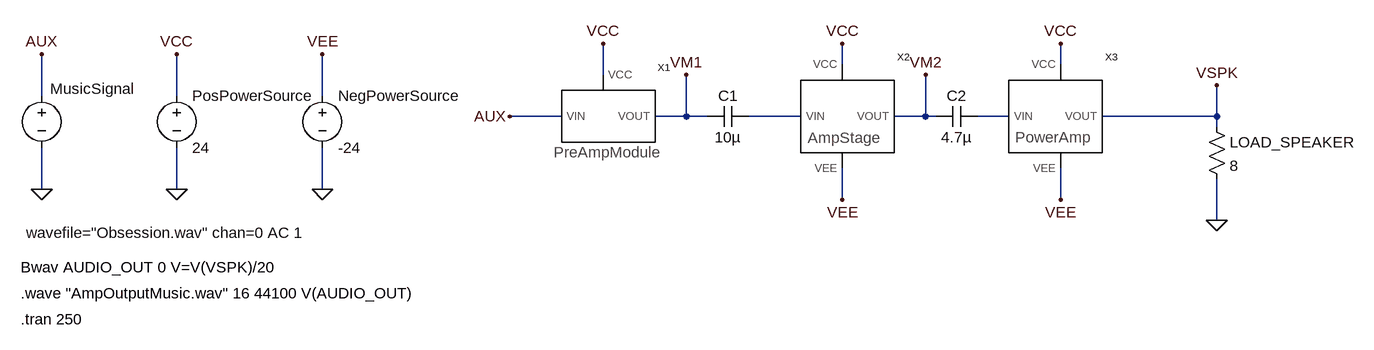
[diagram p0: schematic AnalogOne_AMP_Circuit_Integration.asc]
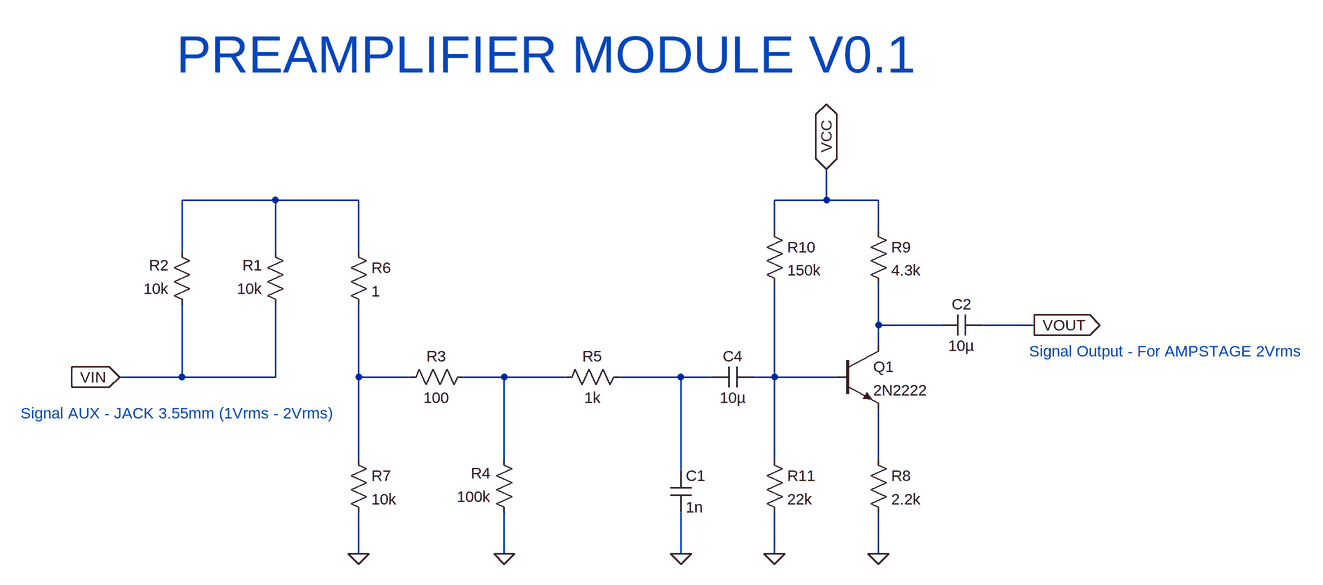
[diagram p1: sub-circuit preamplificacion_ltspice.asc]
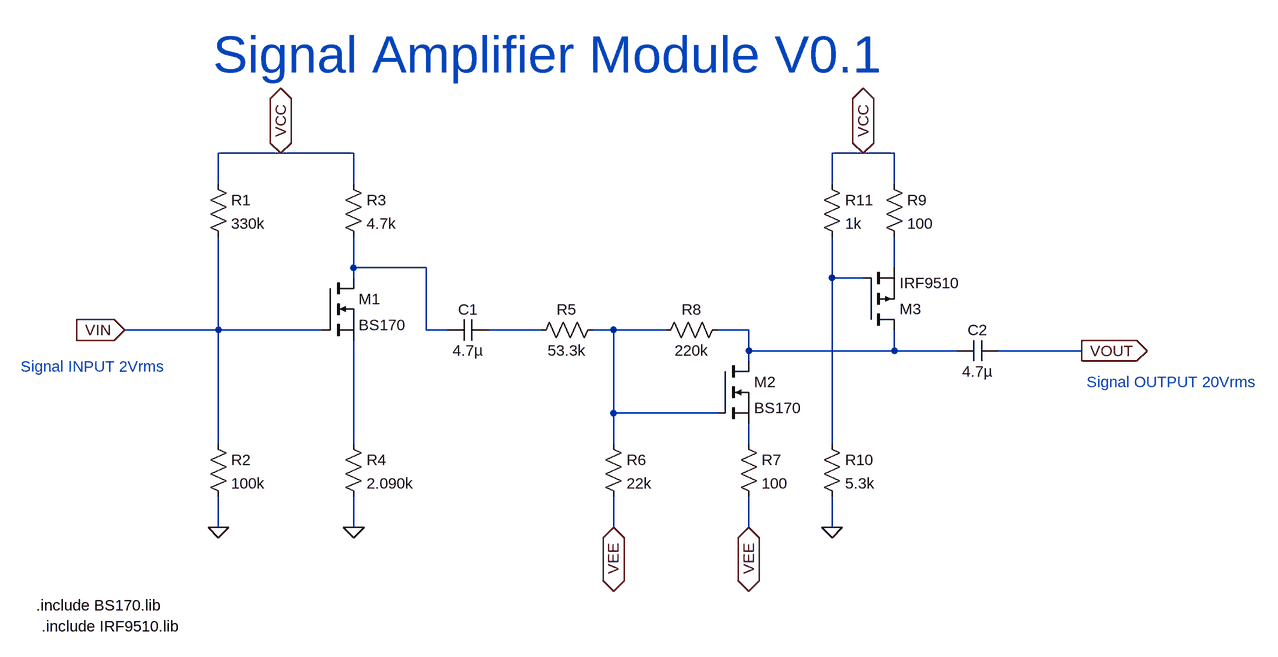
[diagram p2: sub-circuit sigampmodule_ltspice.asc]
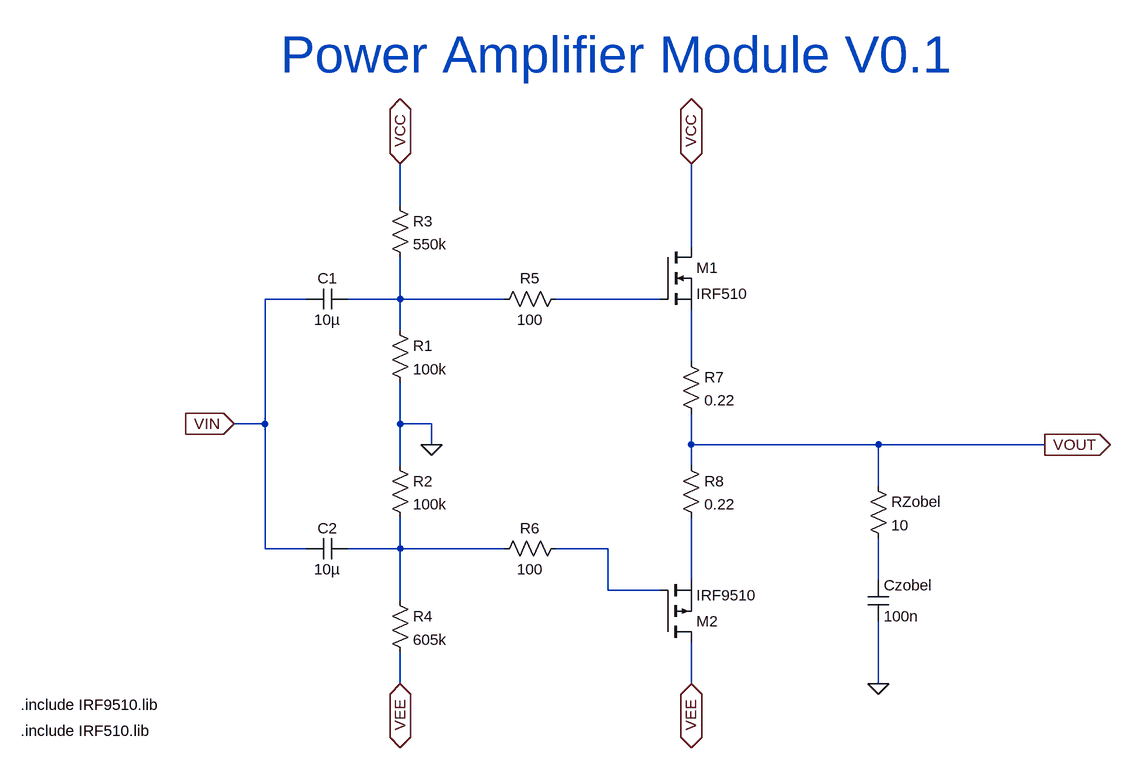
[diagram p3: sub-circuit zpowerampmodule_ltspice.asc]
AnalogOne_AMP_Circuit_Integration.asc, the LTspice schematic file:
Version 4.1
SHEET 1 1312 680
WIRE 528 32 528 0
WIRE 864 32 864 0
WIRE 160 48 160 0
WIRE -704 80 -704 16
WIRE -496 80 -496 16
WIRE -272 80 -272 16
WIRE 96 112 16 112
WIRE 288 112 288 48
WIRE 288 112 240 112
WIRE 320 112 288 112
WIRE 464 112 384 112
WIRE 656 112 656 48
WIRE 656 112 608 112
WIRE 672 112 656 112
WIRE 784 112 736 112
WIRE 1104 112 1104 64
WIRE 1104 112 928 112
WIRE 1104 128 1104 112
WIRE -704 224 -704 160
WIRE -496 224 -496 160
WIRE -272 224 -272 160
WIRE 528 240 528 192
WIRE 864 240 864 192
WIRE 1104 272 1104 208
FLAG -704 16 AUX
FLAG -704 224 0
FLAG -496 224 0
FLAG -496 16 VCC
FLAG -272 224 0
FLAG -272 16 VEE
FLAG 160 0 VCC
FLAG 16 112 AUX
FLAG 528 0 VCC
FLAG 528 240 VEE
FLAG 864 0 VCC
FLAG 864 240 VEE
FLAG 1104 272 0
FLAG 288 48 VM1
FLAG 656 48 VM2
FLAG 1104 64 VSPK
SYMBOL Preamplificacion_LTspice 160 112 R0
SYMATTR InstName X1
SYMBOL voltage -704 64 R0
WINDOW 0 13 5 Left 2
WINDOW 123 40 36 Left 2
WINDOW 39 0 0 Left 0
WINDOW 3 -24 227 Left 2
SYMATTR InstName MusicSignal
SYMATTR Value wavefile="Obsession.wav" chan=0 AC 1
SYMBOL voltage -496 64 R0
WINDOW 123 0 0 Left 0
WINDOW 39 0 0 Left 0
SYMATTR InstName PosPowerSource
SYMATTR Value 24
SYMBOL voltage -272 64 R0
WINDOW 123 0 0 Left 0
WINDOW 39 0 0 Left 0
SYMATTR InstName NegPowerSource
SYMATTR Value -24
SYMBOL SigAmpModule_LTspice 528 112 R0
SYMATTR InstName X2
SYMBOL ZPowerAmpModule_LTspice 848 112 R0
SYMATTR InstName X3
SYMBOL res 1088 112 R0
SYMATTR InstName LOAD_SPEAKER
SYMATTR Value 8
SYMATTR SpiceLine pwr=20
SYMBOL cap 384 96 R90
WINDOW 0 0 32 VBottom 2
WINDOW 3 32 32 VTop 2
SYMATTR InstName C1
SYMATTR Value 10µ
SYMBOL cap 736 96 R90
WINDOW 0 0 32 VBottom 2
WINDOW 3 32 32 VTop 2
SYMATTR InstName C2
SYMATTR Value 4.7µ
TEXT -736 384 Left 2 !.wave "AmpOutputMusic.wav" 16 44100 V(AUDIO_OUT)
TEXT -736 424 Left 2 !.tran 250
TEXT -736 344 Left 2 !Bwav AUDIO_OUT 0 V=V(VSPK)/20

preamplificacion_ltspice.asc, the sub-circuit schematic file:
Version 4.1
SHEET 1 1792 768
WIRE 96 112 -48 112
WIRE 224 112 96 112
WIRE 944 112 944 64
WIRE 944 112 864 112
WIRE 1024 112 944 112
WIRE 864 160 864 112
WIRE 1024 160 1024 112
WIRE -48 192 -48 112
WIRE 96 192 96 112
WIRE 224 192 224 112
WIRE 1024 304 1024 240
WIRE 1120 304 1024 304
WIRE 1264 304 1184 304
WIRE 1024 336 1024 304
WIRE -48 384 -48 272
WIRE -48 384 -144 384
WIRE 96 384 96 272
WIRE 96 384 -48 384
WIRE 224 384 224 272
WIRE 304 384 224 384
WIRE 448 384 384 384
WIRE 544 384 448 384
WIRE 720 384 624 384
WIRE 768 384 720 384
WIRE 864 384 864 240
WIRE 864 384 832 384
WIRE 960 384 864 384
WIRE 224 512 224 384
WIRE 448 512 448 384
WIRE 864 512 864 384
WIRE 1024 512 1024 432
WIRE 720 528 720 384
WIRE 224 656 224 592
WIRE 448 656 448 592
WIRE 720 656 720 592
WIRE 864 656 864 592
WIRE 1024 656 1024 592
FLAG 448 656 0
FLAG 720 656 0
FLAG 224 656 0
FLAG 1024 656 0
FLAG 864 656 0
FLAG -144 384 VIN
IOPIN -144 384 In
FLAG 1264 304 VOUT
IOPIN 1264 304 Out
FLAG 944 64 VCC
IOPIN 944 64 BiDir
SYMBOL res 112 288 R180
WINDOW 0 36 76 Left 2
WINDOW 3 36 40 Left 2
SYMATTR InstName R1
SYMATTR Value 10k
SYMBOL res -32 288 R180
WINDOW 0 36 76 Left 2
WINDOW 3 36 40 Left 2
SYMATTR InstName R2
SYMATTR Value 10k
SYMBOL res 400 368 R90
WINDOW 0 0 56 VBottom 2
WINDOW 3 32 56 VTop 2
SYMATTR InstName R3
SYMATTR Value 100
SYMBOL res 464 608 R180
WINDOW 0 36 76 Left 2
WINDOW 3 36 40 Left 2
SYMATTR InstName R4
SYMATTR Value 100k
SYMBOL res 640 368 R90
WINDOW 0 0 56 VBottom 2
WINDOW 3 32 56 VTop 2
SYMATTR InstName R5
SYMATTR Value 1k
SYMBOL cap 704 528 R0
SYMATTR InstName C1
SYMATTR Value 1n
SYMBOL res 208 176 R0
SYMATTR InstName R6
SYMATTR Value 1
SYMBOL res 208 496 R0
SYMATTR InstName R7
SYMATTR Value 10k
SYMBOL npn 960 336 R0
SYMATTR InstName Q1
SYMATTR Value 2N2222
SYMBOL res 1008 496 R0
SYMATTR InstName R8
SYMATTR Value 2.2k
SYMBOL res 1008 144 R0
SYMATTR InstName R9
SYMATTR Value 4.3k
SYMBOL cap 1184 288 R90
WINDOW 0 0 32 VBottom 2
WINDOW 3 32 32 VTop 2
SYMATTR InstName C2
SYMATTR Value 10µ
SYMBOL res 848 144 R0
SYMATTR InstName R10
SYMATTR Value 150k
SYMBOL cap 832 368 R90
WINDOW 0 0 32 VBottom 2
WINDOW 3 32 32 VTop 2
SYMATTR InstName C4
SYMATTR Value 10µ
SYMBOL res 848 496 R0
SYMATTR InstName R11
SYMATTR Value 22k
TEXT -56 -112 Left 6 ;PREAMPLIFIER MODULE V0.1
TEXT -296 440 Left 2 ;Signal AUX - JACK 3.55mm (1Vrms - 2Vrms)
TEXT 1256 344 Left 2 ;Signal Output - For AMPSTAGE 2Vrms

sigampmodule_ltspice.asc, the sub-circuit schematic file:
Version 4.1
SHEET 1 1688 680
WIRE 176 -80 80 -80
WIRE 288 -80 176 -80
WIRE 1072 -80 1024 -80
WIRE 1120 -80 1072 -80
WIRE 80 -32 80 -80
WIRE 288 -32 288 -80
WIRE 1024 -32 1024 -80
WIRE 1120 -32 1120 -80
WIRE 288 96 288 48
WIRE 400 96 288 96
WIRE 1120 96 1120 48
WIRE 288 112 288 96
WIRE 1024 112 1024 48
WIRE 1072 112 1024 112
WIRE 80 192 80 48
WIRE 80 192 -64 192
WIRE 240 192 80 192
WIRE 400 192 400 96
WIRE 432 192 400 192
WIRE 576 192 496 192
WIRE 688 192 656 192
WIRE 768 192 688 192
WIRE 896 192 848 192
WIRE 896 224 896 192
WIRE 1120 224 1120 192
WIRE 1120 224 896 224
WIRE 1216 224 1120 224
WIRE 1408 224 1280 224
WIRE 896 240 896 224
WIRE 688 320 688 192
WIRE 848 320 688 320
WIRE 80 368 80 192
WIRE 288 368 288 208
WIRE 688 368 688 320
WIRE 896 368 896 336
WIRE 1024 368 1024 112
WIRE 80 496 80 448
WIRE 288 496 288 448
WIRE 688 496 688 448
WIRE 896 496 896 448
WIRE 1024 496 1024 448
FLAG 176 -80 VCC
IOPIN 176 -80 BiDir
FLAG 80 496 0
FLAG -64 192 VIN
IOPIN -64 192 In
FLAG 288 496 0
FLAG 688 496 VEE
IOPIN 688 496 BiDir
FLAG 896 496 VEE
IOPIN 896 496 BiDir
FLAG 1024 496 0
FLAG 1072 -80 VCC
IOPIN 1072 -80 BiDir
FLAG 1408 224 VOUT
IOPIN 1408 224 Out
SYMBOL res 64 -48 R0
SYMATTR InstName R1
SYMATTR Value 330k
SYMBOL res 64 352 R0
SYMATTR InstName R2
SYMATTR Value 100k
SYMBOL res 272 -48 R0
SYMATTR InstName R3
SYMATTR Value 4.7k
SYMBOL res 272 352 R0
SYMATTR InstName R4
SYMATTR Value 2.090k
SYMBOL nmos 240 112 R0
SYMATTR InstName M1
SYMATTR Value BS170
SYMATTR Prefix X
SYMBOL cap 496 176 R90
WINDOW 0 0 32 VBottom 2
WINDOW 3 32 32 VTop 2
SYMATTR InstName C1
SYMATTR Value 4.7µ
SYMBOL res 672 176 R90
WINDOW 0 0 56 VBottom 2
WINDOW 3 32 56 VTop 2
SYMATTR InstName R5
SYMATTR Value 53.3k
SYMBOL res 880 352 R0
SYMATTR InstName R7
SYMATTR Value 100
SYMBOL res 672 352 R0
SYMATTR InstName R6
SYMATTR Value 22k
SYMBOL res 752 208 R270
WINDOW 0 32 56 VTop 2
WINDOW 3 0 56 VBottom 2
SYMATTR InstName R8
SYMATTR Value 220k
SYMBOL nmos 848 240 R0
SYMATTR InstName M2
SYMATTR Value BS170
SYMATTR Prefix X
SYMBOL pmos 1072 192 M180
SYMATTR InstName M3
SYMATTR Value IRF9510
SYMATTR Prefix X
SYMBOL res 1104 -48 R0
SYMATTR InstName R9
SYMATTR Value 100
SYMBOL res 1008 352 R0
SYMATTR InstName R10
SYMATTR Value 5.3k
SYMBOL res 1008 -48 R0
SYMATTR InstName R11
SYMATTR Value 1k
SYMBOL cap 1280 208 R90
WINDOW 0 0 32 VBottom 2
WINDOW 3 32 32 VTop 2
SYMATTR InstName C2
SYMATTR Value 4.7µ
TEXT 72 -232 Left 6 ;Signal Amplifier Module V0.1
TEXT -224 248 Left 2 ;Signal INPUT 2Vrms
TEXT 1416 272 Left 2 ;Signal OUTPUT 20Vrms
TEXT -200 616 Left 2 !.include BS170.lib
TEXT -192 648 Left 2 !.include IRF9510.lib

zpowerampmodule_ltspice.asc, the sub-circuit schematic file:
Version 4.1
SHEET 1 1292 680
WIRE 176 -160 176 -224
WIRE 624 -96 624 -224
WIRE 32 -16 -32 -16
WIRE 176 -16 176 -80
WIRE 176 -16 96 -16
WIRE 336 -16 176 -16
WIRE 576 -16 416 -16
WIRE 176 32 176 -16
WIRE 624 80 624 0
WIRE -32 176 -32 -16
WIRE -32 176 -80 176
WIRE 176 176 176 112
WIRE 224 176 176 176
WIRE 224 208 224 176
WIRE 624 208 624 160
WIRE 912 208 624 208
WIRE 1168 208 912 208
WIRE 176 240 176 176
WIRE 624 240 624 208
WIRE 912 272 912 208
WIRE -32 368 -32 176
WIRE 32 368 -32 368
WIRE 176 368 176 320
WIRE 176 368 96 368
WIRE 336 368 176 368
WIRE 496 368 416 368
WIRE 624 416 624 320
WIRE 912 416 912 352
WIRE 496 432 496 368
WIRE 576 432 496 432
WIRE 176 448 176 368
WIRE 176 576 176 528
WIRE 624 576 624 512
WIRE 912 576 912 480
FLAG -80 176 VIN
IOPIN -80 176 In
FLAG 224 208 0
FLAG 176 -224 VCC
IOPIN 176 -224 BiDir
FLAG 176 576 VEE
IOPIN 176 576 BiDir
FLAG 624 -224 VCC
IOPIN 624 -224 BiDir
FLAG 624 576 VEE
IOPIN 624 576 BiDir
FLAG 912 576 0
FLAG 1168 208 VOUT
IOPIN 1168 208 Out
SYMBOL res 160 16 R0
SYMATTR InstName R1
SYMATTR Value 100k
SYMBOL res 160 224 R0
SYMATTR InstName R2
SYMATTR Value 100k
SYMBOL res 160 -176 R0
SYMATTR InstName R3
SYMATTR Value 550k
SYMBOL res 160 432 R0
SYMATTR InstName R4
SYMATTR Value 605k
SYMBOL res 432 -32 R90
WINDOW 0 0 56 VBottom 2
WINDOW 3 32 56 VTop 2
SYMATTR InstName R5
SYMATTR Value 100
SYMBOL res 432 352 R90
WINDOW 0 0 56 VBottom 2
WINDOW 3 32 56 VTop 2
SYMATTR InstName R6
SYMATTR Value 100
SYMBOL pmos 576 512 M180
SYMATTR InstName M2
SYMATTR Value IRF9510
SYMATTR Prefix X
SYMBOL res 608 64 R0
SYMATTR InstName R7
SYMATTR Value 0.22
SYMATTR SpiceLine pwr=5
SYMBOL res 608 224 R0
SYMATTR InstName R8
SYMATTR Value 0.22
SYMATTR SpiceLine pwr=5
SYMBOL res 896 256 R0
SYMATTR InstName RZobel
SYMATTR Value 10
SYMBOL cap 896 416 R0
SYMATTR InstName Czobel
SYMATTR Value 100n
SYMBOL nmos 576 -96 R0
SYMATTR InstName M1
SYMATTR Value IRF510
SYMATTR Prefix X
SYMBOL cap 96 -32 R90
WINDOW 0 0 32 VBottom 2
WINDOW 3 32 32 VTop 2
SYMATTR InstName C1
SYMATTR Value 10µ
SYMBOL cap 96 352 R90
WINDOW 0 0 32 VBottom 2
WINDOW 3 32 32 VTop 2
SYMATTR InstName C2
SYMATTR Value 10µ
TEXT -8 -392 Left 6 ;Power Amplifier Module V0.1
TEXT -408 608 Left 2 !.include IRF9510.lib
TEXT -408 648 Left 2 !.include IRF510.lib

The netlist it stands for:
* AnalogOne_AMP_Circuit_Integration.asc
X§X1 AUX VCC VM1 preamplificacion_ltspice
V§MusicSignal AUX 0 wavefile="Obsession.wav" chan=0 AC 1
V§PosPowerSource VCC 0 24
V§NegPowerSource VEE 0 -24
X§X2 N001 VCC VEE VM2 sigampmodule_ltspice
X§X3 N002 VCC VEE VSPK zpowerampmodule_ltspice
R§LOAD_SPEAKER VSPK 0 8 pwr=20
C1 N001 VM1 10µ
C2 N002 VM2 4.7µ

* block symbol definitions
.subckt preamplificacion_ltspice VIN VCC VOUT
R1 VIN N001 10k
R2 VIN N001 10k
R3 N004 N003 100
R4 0 N004 100k
R5 N005 N004 1k
C1 N005 0 1n
R6 N001 N003 1
R7 N003 0 10k
Q1 N002 N006 N007 0 2N2222
R8 N007 0 2.2k
R9 VCC N002 4.3k
C2 VOUT N002 10µ
R10 VCC N006 150k
C4 N006 N005 10µ
R11 N006 0 22k
* PREAMPLIFIER MODULE V0.1
* Signal AUX - JACK 3.55mm (1Vrms - 2Vrms)
* Signal Output - For AMPSTAGE 2Vrms
.ends preamplificacion_ltspice

.subckt sigampmodule_ltspice VIN VCC VEE VOUT
R1 VCC VIN 330k
R2 VIN 0 100k
R3 VCC N001 4.7k
R4 N007 0 2.090k
X§M1 N001 VIN N007 BS170  ; pins D G S
C1 N004 N001 4.7µ
R5 N005 N004 53.3k
R7 N008 VEE 100
R6 N005 VEE 22k
R8 N005 N006 220k
X§M2 N006 N005 N008 BS170  ; pins D G S
X§M3 N006 N003 N002 IRF9510  ; pins D G S
R9 VCC N002 100
R10 N003 0 5.3k
R11 VCC N003 1k
C2 VOUT N006 4.7µ
* Signal Amplifier Module V0.1
* Signal INPUT 2Vrms
* Signal OUTPUT 20Vrms
.include BS170.lib
.include IRF9510.lib
.ends sigampmodule_ltspice

.subckt zpowerampmodule_ltspice VIN VCC VEE VOUT
R1 N001 0 100k
R2 0 N004 100k
R3 VCC N001 550k
R4 N004 VEE 605k
R5 N002 N001 100
R6 N005 N004 100
X§M2 VEE N005 N006 IRF9510  ; pins D G S
R7 N003 VOUT 0.22 pwr=5
R8 VOUT N006 0.22 pwr=5
RZobel VOUT N007 10
Czobel N007 0 100n
X§M1 VCC N002 N003 IRF510  ; pins D G S
C1 N001 VIN 10µ
C2 N004 VIN 10µ
* Power Amplifier Module V0.1
.include IRF9510.lib
.include IRF510.lib
.ends zpowerampmodule_ltspice

.model NPN NPN
.model PNP PNP
.lib standard.bjt
.wave "AmpOutputMusic.wav" 16 44100 V(AUDIO_OUT)
.tran 250
Bwav AUDIO_OUT 0 V=V(VSPK)/20
.backanno
.end